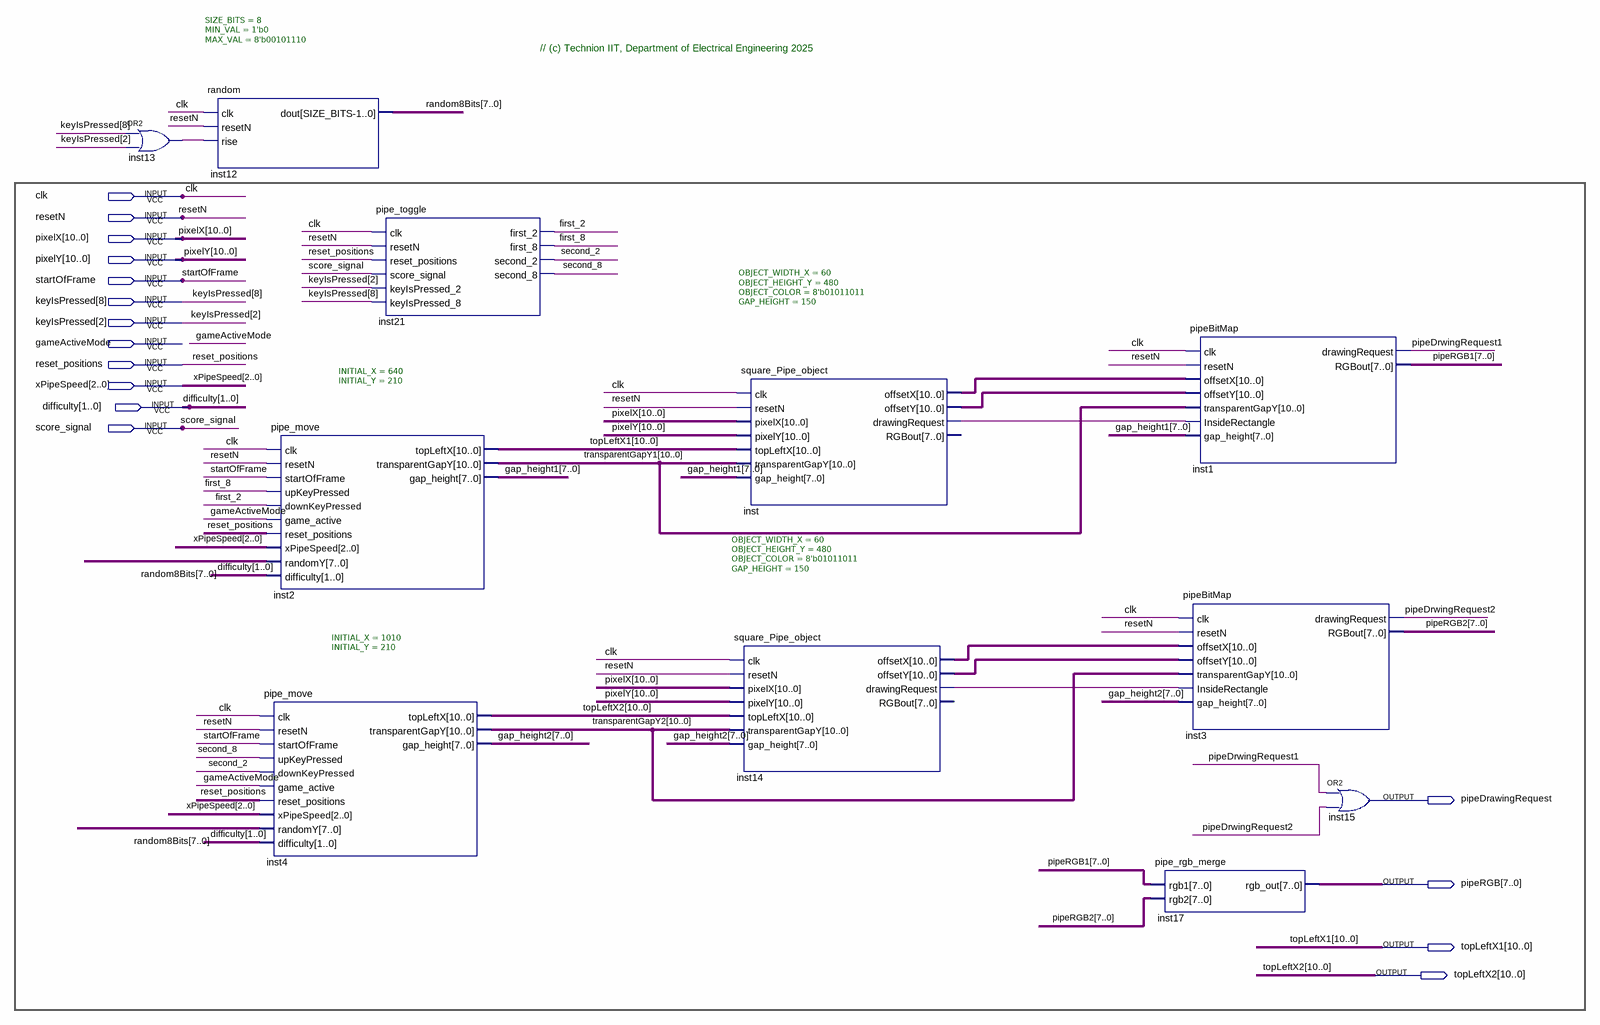
[diagram p0: schematic sheet]
// Quartus schematic PIPE_DISPLAY.bdf as structural Verilog: 11 symbols, 16 pins
module PIPE_DISPLAY (
  input  clk,
  input  resetN,
  input  [10:0] pixelX,
  input  [10:0] pixelY,
  input  startOfFrame,
  input  [8:2] keyIsPressed,
  input  gameActiveMode,
  input  reset_positions,
  input  [2:0] xPipeSpeed,
  input  [1:0] difficulty,
  input  score_signal,
  output pipeDrawingRequest,
  output [7:0] pipeRGB,
  output [10:0] topLeftX1,
  output [10:0] topLeftX2
);

  wire first_2, first_8, inst13_out, inst14_drawingrequest, inst_drawingrequest, pipeDrwingRequest1,
       pipeDrwingRequest2, second_2, second_8;
  wire [7:0] gap_height1, gap_height2, pipeRGB1, pipeRGB2, random8Bits;
  wire [10:0] inst14_offsetx, inst14_offsety, inst_offsetx, inst_offsety, transparentGapY1, transparentGapY2;

  or inst13 (inst13_out, keyIsPressed[8], keyIsPressed[2]);
  random #(.SIZE_BITS(8), .MIN_VAL(1'b0), .MAX_VAL(8'b00101110)) inst12 (
    .clk(clk), .resetN(resetN), .rise(inst13_out), .dout(random8Bits));
  pipe_move #(.INITIAL_X(1010), .INITIAL_Y(210)) inst4 (
    .clk(clk), .resetN(resetN), .startOfFrame(startOfFrame), .upKeyPressed(second_8),
    .downKeyPressed(second_2), .game_active(gameActiveMode), .reset_positions(reset_positions),
    .xPipeSpeed(xPipeSpeed), .randomY(random8Bits), .difficulty(difficulty), .topLeftX(topLeftX2),
    .transparentGapY(transparentGapY2), .gap_height(gap_height2));
  pipe_move #(.INITIAL_X(640), .INITIAL_Y(210)) inst2 (
    .clk(clk), .resetN(resetN), .startOfFrame(startOfFrame), .upKeyPressed(first_8),
    .downKeyPressed(first_2), .game_active(gameActiveMode), .reset_positions(reset_positions),
    .xPipeSpeed(xPipeSpeed), .randomY(random8Bits), .difficulty(difficulty), .topLeftX(topLeftX1),
    .transparentGapY(transparentGapY1), .gap_height(gap_height1));
  pipe_toggle inst21 (
    .clk(clk), .resetN(resetN), .reset_positions(reset_positions), .score_signal(score_signal),
    .keyIsPressed_2(keyIsPressed[2]), .keyIsPressed_8(keyIsPressed[8]), .first_2(first_2), .first_8(first_8),
    .second_2(second_2), .second_8(second_8));
  square_Pipe_object #(.OBJECT_WIDTH_X(60), .OBJECT_HEIGHT_Y(480), .OBJECT_COLOR(8'b01011011), .GAP_HEIGHT(150)) inst (
    .clk(clk), .resetN(resetN), .pixelX(pixelX), .pixelY(pixelY), .topLeftX(topLeftX1),
    .transparentGapY(transparentGapY1), .gap_height(gap_height1), .offsetX(inst_offsetx),
    .offsetY(inst_offsety), .drawingRequest(inst_drawingrequest));  // open: RGBout
  square_Pipe_object #(.OBJECT_WIDTH_X(60), .OBJECT_HEIGHT_Y(480), .OBJECT_COLOR(8'b01011011), .GAP_HEIGHT(150)) inst14 (
    .clk(clk), .resetN(resetN), .pixelX(pixelX), .pixelY(pixelY), .topLeftX(topLeftX2),
    .transparentGapY(transparentGapY2), .gap_height(gap_height2), .offsetX(inst14_offsetx),
    .offsetY(inst14_offsety), .drawingRequest(inst14_drawingrequest));  // open: RGBout
  pipe_rgb_merge inst17 (.rgb1(pipeRGB1), .rgb2(pipeRGB2), .rgb_out(pipeRGB));
  pipeBitMap inst1 (
    .clk(clk), .resetN(resetN), .offsetX(inst_offsetx), .offsetY(inst_offsety),
    .transparentGapY(transparentGapY1), .InsideRectangle(inst_drawingrequest), .gap_height(gap_height1),
    .drawingRequest(pipeDrwingRequest1), .RGBout(pipeRGB1));
  pipeBitMap inst3 (
    .clk(clk), .resetN(resetN), .offsetX(inst14_offsetx), .offsetY(inst14_offsety),
    .transparentGapY(transparentGapY2), .InsideRectangle(inst14_drawingrequest), .gap_height(gap_height2),
    .drawingRequest(pipeDrwingRequest2), .RGBout(pipeRGB2));
  or inst15 (pipeDrawingRequest, pipeDrwingRequest1, pipeDrwingRequest2);

  // Notes on the sheet:
  //   // (c) Technion IIT, Department of Electrical Engineering 2025
endmodule
